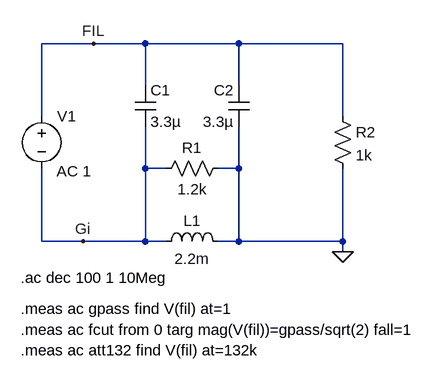
[diagram p0: schematic SMPS_EMCfilter.asc]
SMPS_EMCfilter.asc, the LTspice schematic file:
Version 4.1
SHEET 1 880 680
WIRE 48 -48 -32 -48
WIRE 128 -48 48 -48
WIRE 272 -48 128 -48
WIRE 432 -48 272 -48
WIRE 128 16 128 -48
WIRE 272 16 272 -48
WIRE -32 64 -32 -48
WIRE 432 64 432 -48
WIRE 128 144 128 80
WIRE 160 144 128 144
WIRE 272 144 272 80
WIRE 272 144 240 144
WIRE -32 256 -32 144
WIRE 32 256 -32 256
WIRE 128 256 128 144
WIRE 128 256 32 256
WIRE 160 256 128 256
WIRE 272 256 272 144
WIRE 272 256 240 256
WIRE 432 256 432 144
WIRE 432 256 272 256
WIRE 432 272 432 256
FLAG 432 272 0
FLAG 32 256 Gi
FLAG 48 -48 FIL
SYMBOL cap 112 16 R0
SYMATTR InstName C1
SYMATTR Value 3.3µ
SYMATTR SpiceLine V=400
SYMBOL cap 288 16 M0
SYMATTR InstName C2
SYMATTR Value 3.3µ
SYMATTR SpiceLine V=400
SYMBOL ind 144 272 R270
WINDOW 0 32 56 VTop 2
WINDOW 3 5 56 VBottom 2
SYMATTR InstName L1
SYMATTR Value 2.2m
SYMBOL res 256 128 R90
WINDOW 0 0 56 VBottom 2
WINDOW 3 32 56 VTop 2
SYMATTR InstName R1
SYMATTR Value 1.2k
SYMBOL voltage -32 48 R0
WINDOW 123 23 100 Left 2
WINDOW 39 0 0 Left 0
SYMATTR InstName V1
SYMATTR Value ""
SYMATTR Value2 AC 1
SYMBOL res 416 48 R0
SYMATTR InstName R2
SYMATTR Value 1k
TEXT -64 312 Left 2 !.ac dec 100 1 10Meg
TEXT -64 424 Left 2 !.meas ac att132 find V(fil) at=132k
TEXT -64 392 Left 2 !.meas ac fcut from 0 targ mag(V(fil))=gpass/sqrt(2) fall=1
TEXT -64 360 Left 2 !.meas ac gpass find V(fil) at=1

The netlist it stands for:
* SMPS_EMCfilter.asc
C1 FIL Gi 3.3µ V=400
C2 FIL 0 3.3µ V=400
L1 Gi 0 2.2m
R1 0 Gi 1.2k
V1 FIL Gi AC 1
R2 FIL 0 1k
.ac dec 100 1 10Meg
.meas ac att132 find V(fil) at=132k
.meas ac fcut from 0 targ mag(V(fil))=gpass/sqrt(2) fall=1
.meas ac gpass find V(fil) at=1
.backanno
.end